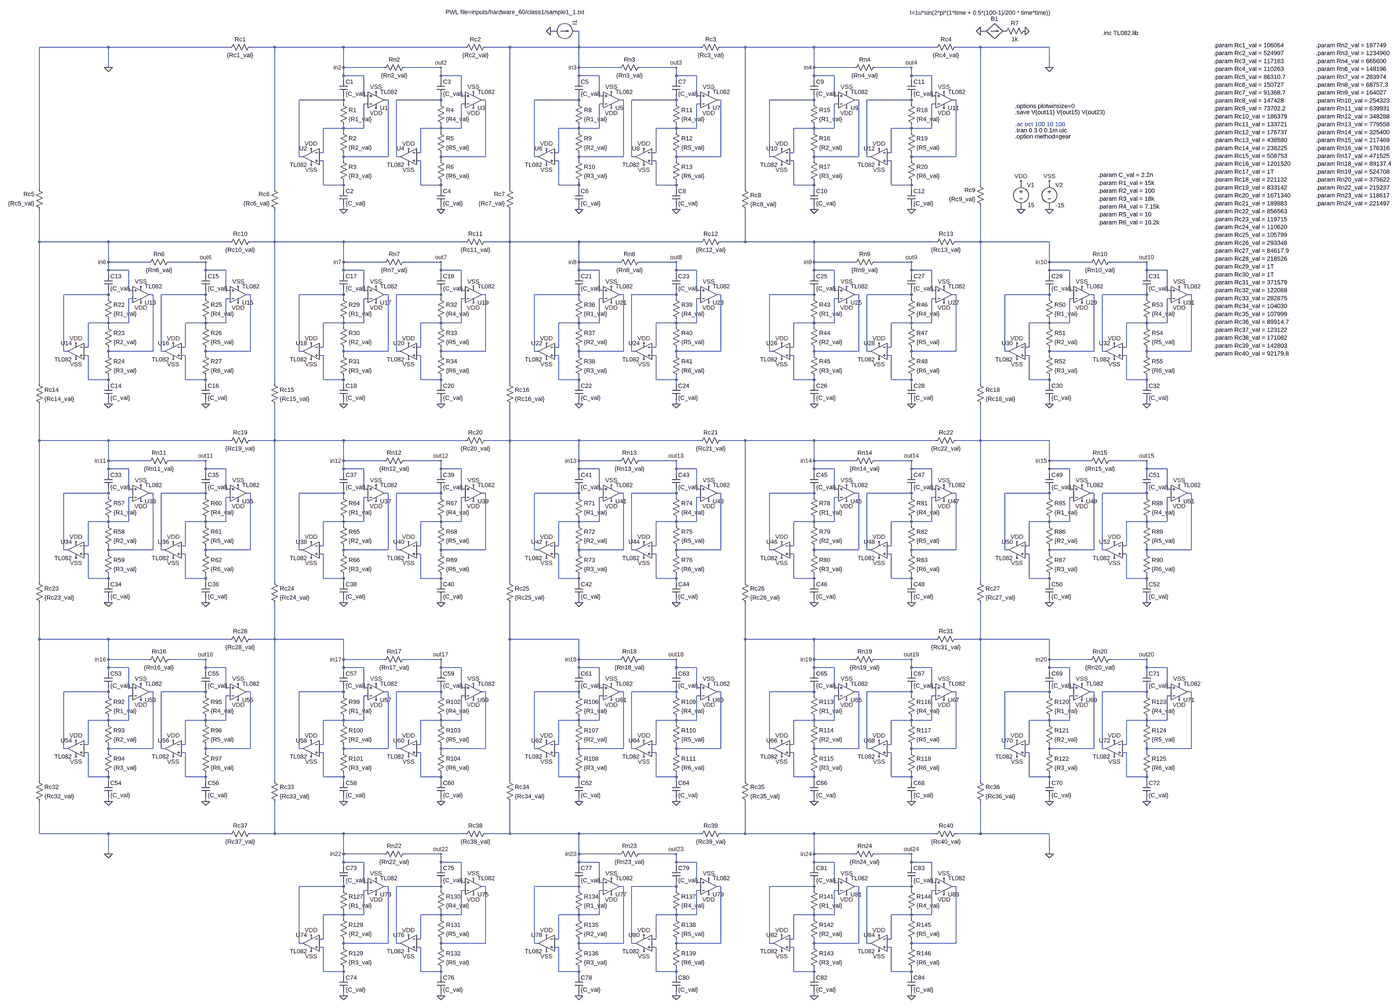
[diagram p0: schematic pulse_tactile.asc, whole sheet]
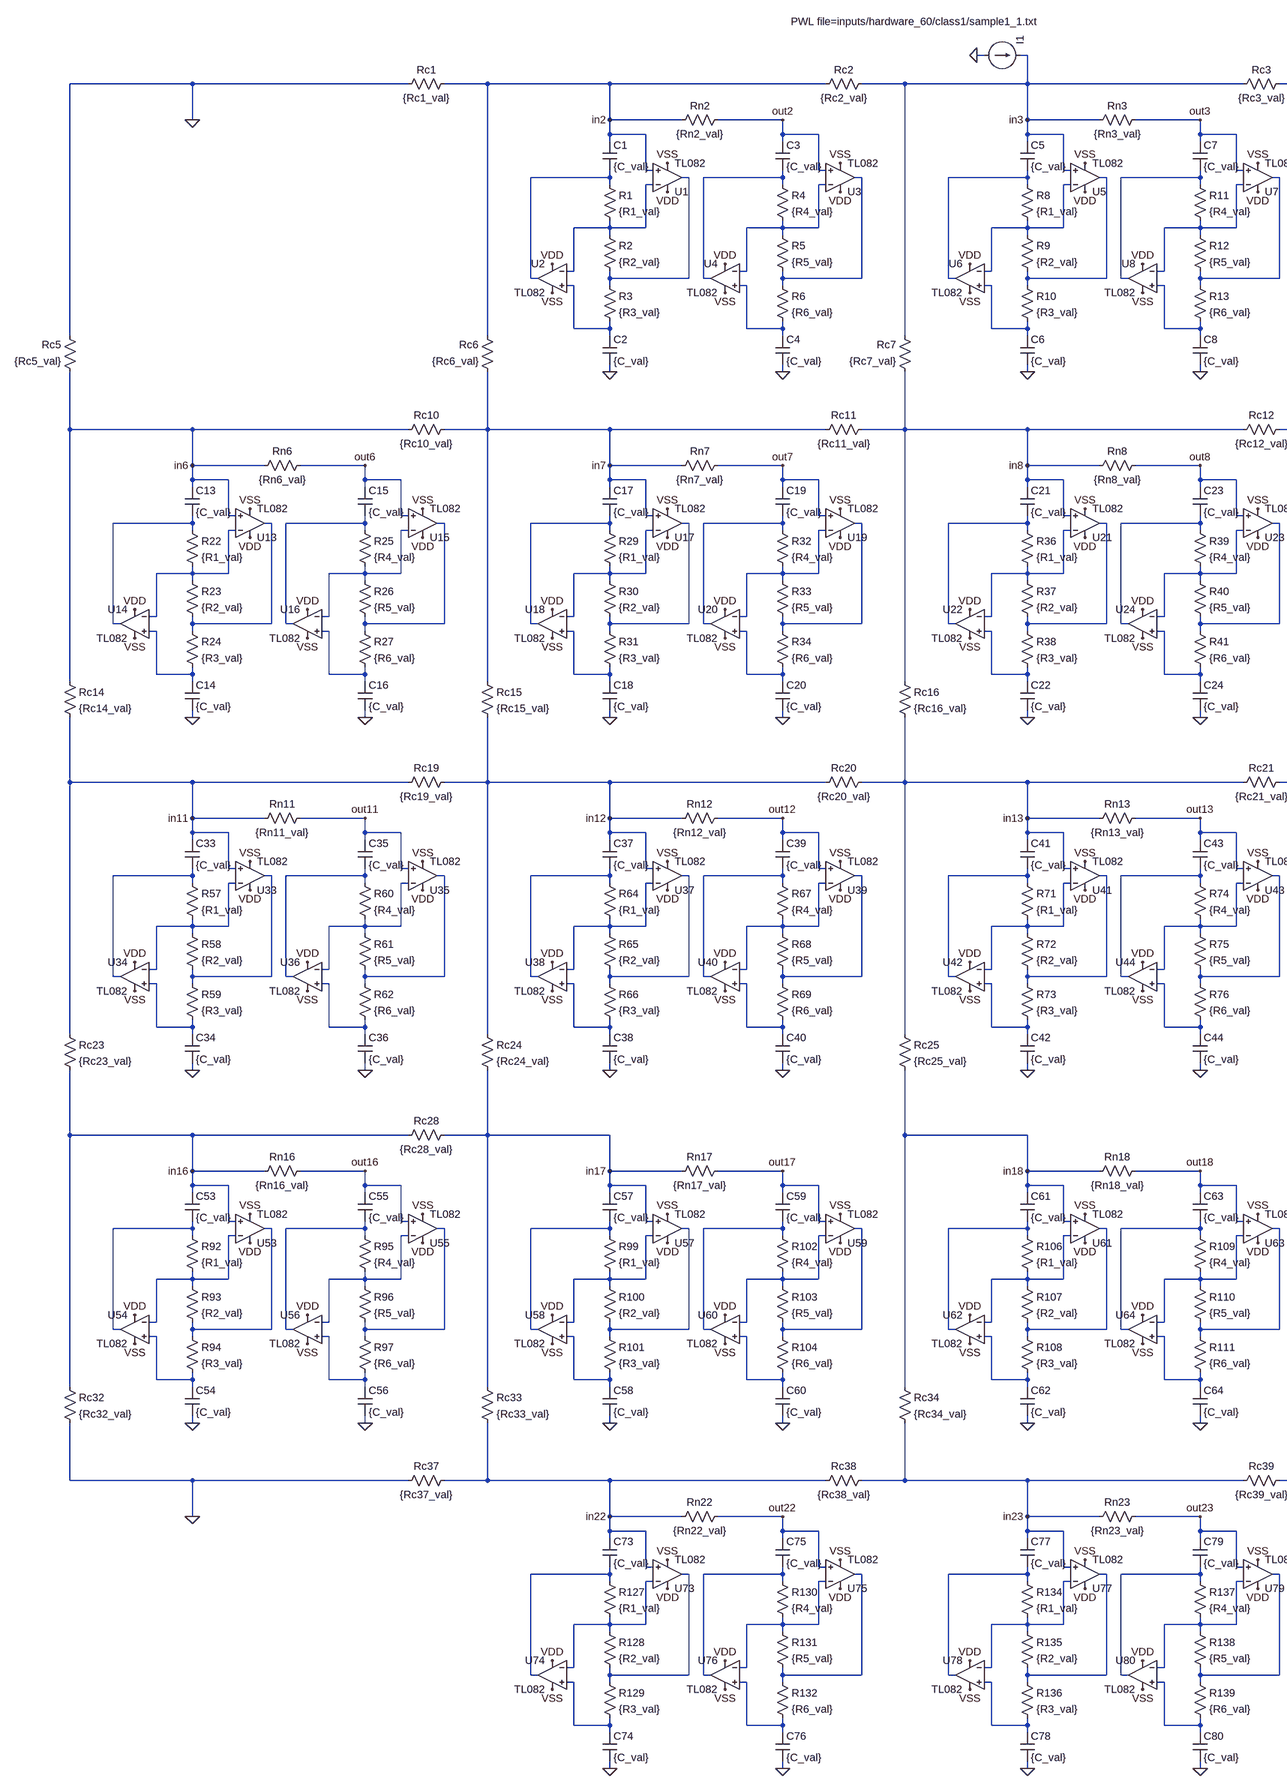
[diagram p1: schematic pulse_tactile.asc, part, row 1 of 1, column 1 of 2]
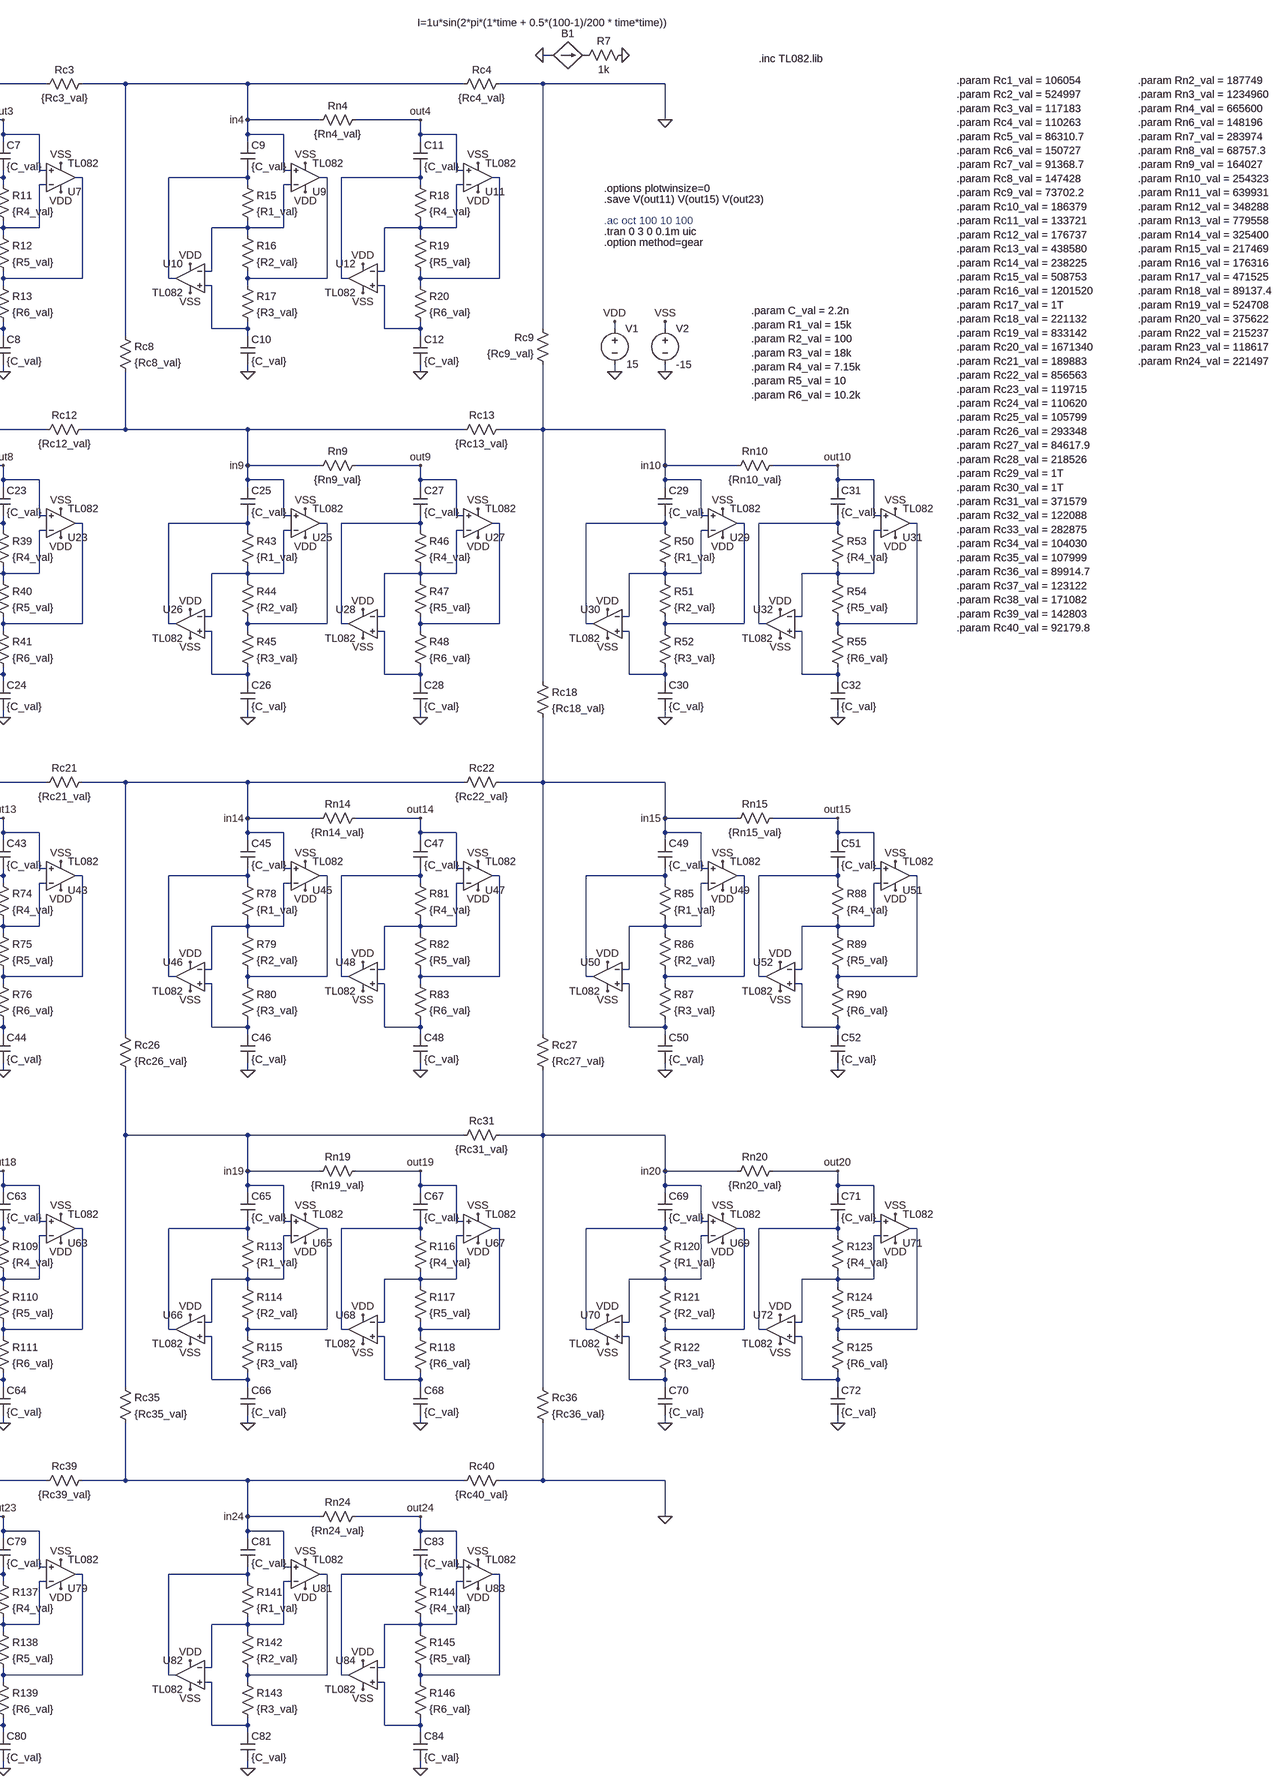
[diagram p2: schematic pulse_tactile.asc, part, row 1 of 1, column 2 of 2]
* pulse_tactile.asc
V1 VDD 0 15
V2 VSS 0 -15
C1 in2 N001 {C_val}
R1 N001 N013 {R1_val}
R2 N013 N002 {R2_val}
R3 N002 N019 {R3_val}
C2 N019 0 {C_val}
C3 out2 N003 {C_val}
R4 N003 N014 {R4_val}
R5 N014 N004 {R5_val}
R6 N004 N020 {R6_val}
C4 N020 0 {C_val}
Rn2 out2 in2 {Rn2_val}
C5 in3 N005 {C_val}
R8 N005 N015 {R1_val}
R9 N015 N006 {R2_val}
R10 N006 N021 {R3_val}
C6 N021 0 {C_val}
C7 out3 N007 {C_val}
R11 N007 N016 {R4_val}
R12 N016 N008 {R5_val}
R13 N008 N022 {R6_val}
C8 N022 0 {C_val}
Rn3 out3 in3 {Rn3_val}
C9 in4 N009 {C_val}
R15 N009 N017 {R1_val}
R16 N017 N010 {R2_val}
R17 N010 N023 {R3_val}
C10 N023 0 {C_val}
C11 out4 N011 {C_val}
R18 N011 N018 {R4_val}
R19 N018 N012 {R5_val}
R20 N012 N024 {R6_val}
C12 N024 0 {C_val}
Rn4 out4 in4 {Rn4_val}
C13 in6 N025 {C_val}
R22 N025 N045 {R1_val}
R23 N045 N026 {R2_val}
R24 N026 N055 {R3_val}
C14 N055 0 {C_val}
C15 out6 N027 {C_val}
R25 N027 N046 {R4_val}
R26 N046 N028 {R5_val}
R27 N028 N056 {R6_val}
C16 N056 0 {C_val}
Rn6 out6 in6 {Rn6_val}
C17 in7 N029 {C_val}
R29 N029 N047 {R1_val}
R30 N047 N030 {R2_val}
R31 N030 N057 {R3_val}
C18 N057 0 {C_val}
C19 out7 N031 {C_val}
R32 N031 N048 {R4_val}
R33 N048 N032 {R5_val}
R34 N032 N058 {R6_val}
C20 N058 0 {C_val}
Rn7 out7 in7 {Rn7_val}
C21 in8 N033 {C_val}
R36 N033 N049 {R1_val}
R37 N049 N034 {R2_val}
R38 N034 N059 {R3_val}
C22 N059 0 {C_val}
C23 out8 N035 {C_val}
R39 N035 N050 {R4_val}
R40 N050 N036 {R5_val}
R41 N036 N060 {R6_val}
C24 N060 0 {C_val}
Rn8 out8 in8 {Rn8_val}
C25 in9 N037 {C_val}
R43 N037 N051 {R1_val}
R44 N051 N038 {R2_val}
R45 N038 N061 {R3_val}
C26 N061 0 {C_val}
C27 out9 N039 {C_val}
R46 N039 N052 {R4_val}
R47 N052 N040 {R5_val}
R48 N040 N062 {R6_val}
C28 N062 0 {C_val}
Rn9 out9 in9 {Rn9_val}
C29 in10 N041 {C_val}
R50 N041 N053 {R1_val}
R51 N053 N042 {R2_val}
R52 N042 N063 {R3_val}
C30 N063 0 {C_val}
C31 out10 N043 {C_val}
R53 N043 N054 {R4_val}
R54 N054 N044 {R5_val}
R55 N044 N064 {R6_val}
C32 N064 0 {C_val}
Rn10 out10 in10 {Rn10_val}
C33 in11 N065 {C_val}
R57 N065 N085 {R1_val}
R58 N085 N066 {R2_val}
R59 N066 N095 {R3_val}
C34 N095 0 {C_val}
C35 out11 N067 {C_val}
R60 N067 N086 {R4_val}
R61 N086 N068 {R5_val}
R62 N068 N096 {R6_val}
C36 N096 0 {C_val}
Rn11 out11 in11 {Rn11_val}
C37 in12 N069 {C_val}
R64 N069 N087 {R1_val}
R65 N087 N070 {R2_val}
R66 N070 N097 {R3_val}
C38 N097 0 {C_val}
C39 out12 N071 {C_val}
R67 N071 N088 {R4_val}
R68 N088 N072 {R5_val}
R69 N072 N098 {R6_val}
C40 N098 0 {C_val}
Rn12 out12 in12 {Rn12_val}
C41 in13 N073 {C_val}
R71 N073 N089 {R1_val}
R72 N089 N074 {R2_val}
R73 N074 N099 {R3_val}
C42 N099 0 {C_val}
C43 out13 N075 {C_val}
R74 N075 N090 {R4_val}
R75 N090 N076 {R5_val}
R76 N076 N100 {R6_val}
C44 N100 0 {C_val}
Rn13 out13 in13 {Rn13_val}
C45 in14 N077 {C_val}
R78 N077 N091 {R1_val}
R79 N091 N078 {R2_val}
R80 N078 N101 {R3_val}
C46 N101 0 {C_val}
C47 out14 N079 {C_val}
R81 N079 N092 {R4_val}
R82 N092 N080 {R5_val}
R83 N080 N102 {R6_val}
C48 N102 0 {C_val}
Rn14 out14 in14 {Rn14_val}
C49 in15 N081 {C_val}
R85 N081 N093 {R1_val}
R86 N093 N082 {R2_val}
R87 N082 N103 {R3_val}
C50 N103 0 {C_val}
C51 out15 N083 {C_val}
R88 N083 N094 {R4_val}
R89 N094 N084 {R5_val}
R90 N084 N104 {R6_val}
C52 N104 0 {C_val}
Rn15 out15 in15 {Rn15_val}
C53 in16 N105 {C_val}
R92 N105 N125 {R1_val}
R93 N125 N106 {R2_val}
R94 N106 N135 {R3_val}
C54 N135 0 {C_val}
C55 out16 N107 {C_val}
R95 N107 N126 {R4_val}
R96 N126 N108 {R5_val}
R97 N108 N136 {R6_val}
C56 N136 0 {C_val}
Rn16 out16 in16 {Rn16_val}
C57 in17 N109 {C_val}
R99 N109 N127 {R1_val}
R100 N127 N110 {R2_val}
R101 N110 N137 {R3_val}
C58 N137 0 {C_val}
C59 out17 N111 {C_val}
R102 N111 N128 {R4_val}
R103 N128 N112 {R5_val}
R104 N112 N138 {R6_val}
C60 N138 0 {C_val}
Rn17 out17 in17 {Rn17_val}
C61 in18 N113 {C_val}
R106 N113 N129 {R1_val}
R107 N129 N114 {R2_val}
R108 N114 N139 {R3_val}
C62 N139 0 {C_val}
C63 out18 N115 {C_val}
R109 N115 N130 {R4_val}
R110 N130 N116 {R5_val}
R111 N116 N140 {R6_val}
C64 N140 0 {C_val}
Rn18 out18 in18 {Rn18_val}
C65 in19 N117 {C_val}
R113 N117 N131 {R1_val}
R114 N131 N118 {R2_val}
R115 N118 N141 {R3_val}
C66 N141 0 {C_val}
C67 out19 N119 {C_val}
R116 N119 N132 {R4_val}
R117 N132 N120 {R5_val}
R118 N120 N142 {R6_val}
C68 N142 0 {C_val}
Rn19 out19 in19 {Rn19_val}
C69 in20 N121 {C_val}
R120 N121 N133 {R1_val}
R121 N133 N122 {R2_val}
R122 N122 N143 {R3_val}
C70 N143 0 {C_val}
C71 out20 N123 {C_val}
R123 N123 N134 {R4_val}
R124 N134 N124 {R5_val}
R125 N124 N144 {R6_val}
C72 N144 0 {C_val}
Rn20 out20 in20 {Rn20_val}
C73 in22 N145 {C_val}
R127 N145 N157 {R1_val}
R128 N157 N146 {R2_val}
R129 N146 N163 {R3_val}
C74 N163 0 {C_val}
C75 out22 N147 {C_val}
R130 N147 N158 {R4_val}
R131 N158 N148 {R5_val}
R132 N148 N164 {R6_val}
C76 N164 0 {C_val}
Rn22 out22 in22 {Rn22_val}
C77 in23 N149 {C_val}
R134 N149 N159 {R1_val}
R135 N159 N150 {R2_val}
R136 N150 N165 {R3_val}
C78 N165 0 {C_val}
C79 out23 N151 {C_val}
R137 N151 N160 {R4_val}
R138 N160 N152 {R5_val}
R139 N152 N166 {R6_val}
C80 N166 0 {C_val}
Rn23 out23 in23 {Rn23_val}
C81 in24 N153 {C_val}
R141 N153 N161 {R1_val}
R142 N161 N154 {R2_val}
R143 N154 N167 {R3_val}
C82 N167 0 {C_val}
C83 out24 N155 {C_val}
R144 N155 N162 {R4_val}
R145 N162 N156 {R5_val}
R146 N156 N168 {R6_val}
C84 N168 0 {C_val}
Rn24 out24 in24 {Rn24_val}
Rc2 in3 in2 {Rc2_val}
Rc3 in4 in3 {Rc3_val}
Rc6 in7 in2 {Rc6_val}
Rc7 in8 in3 {Rc7_val}
Rc11 in7 in8 {Rc11_val}
Rc12 in8 in9 {Rc12_val}
Rc13 in9 in10 {Rc13_val}
Rc14 in6 in11 {Rc14_val}
Rc15 in7 in12 {Rc15_val}
Rc16 in8 in13 {Rc16_val}
Rc18 in10 in15 {Rc18_val}
Rc21 in14 in13 {Rc21_val}
Rc22 in15 in14 {Rc22_val}
Rc23 in11 in16 {Rc23_val}
Rc24 in12 in17 {Rc24_val}
Rc25 in13 in18 {Rc25_val}
Rc26 in14 in19 {Rc26_val}
Rc27 in15 in20 {Rc27_val}
Rc28 in17 in16 {Rc28_val}
Rc32 in16 0 {Rc32_val}
Rc33 in17 in22 {Rc33_val}
Rc34 in18 in23 {Rc34_val}
Rc35 in19 in24 {Rc35_val}
Rc36 in20 0 {Rc36_val}
Rc1 in2 0 {Rc1_val}
Rc5 in6 0 {Rc5_val}
Rc9 in10 0 {Rc9_val}
Rc4 in4 0 {Rc4_val}
Rc37 in22 0 {Rc37_val}
Rc38 in23 in22 {Rc38_val}
Rc39 in24 in23 {Rc39_val}
Rc40 0 in24 {Rc40_val}
R7 0 P001 1k
B1 0 P001 I=1u*sin(2*pi*(1*time + 0.5*(100-1)/200 * time*time))
I1 0 in3 PWL file=inputs/hardware_60/class1/sample1_1.txt
X§U1 in2 N013 VDD VSS N002 TL082  ; pins In+ In- V+ V- OUT
X§U2 N019 N013 VDD VSS N001 TL082  ; pins In+ In- V+ V- OUT
X§U3 out2 N014 VDD VSS N004 TL082  ; pins In+ In- V+ V- OUT
X§U4 N020 N014 VDD VSS N003 TL082  ; pins In+ In- V+ V- OUT
X§U5 in3 N015 VDD VSS N006 TL082  ; pins In+ In- V+ V- OUT
X§U6 N021 N015 VDD VSS N005 TL082  ; pins In+ In- V+ V- OUT
X§U7 out3 N016 VDD VSS N008 TL082  ; pins In+ In- V+ V- OUT
X§U8 N022 N016 VDD VSS N007 TL082  ; pins In+ In- V+ V- OUT
X§U9 in4 N017 VDD VSS N010 TL082  ; pins In+ In- V+ V- OUT
X§U10 N023 N017 VDD VSS N009 TL082  ; pins In+ In- V+ V- OUT
X§U11 out4 N018 VDD VSS N012 TL082  ; pins In+ In- V+ V- OUT
X§U12 N024 N018 VDD VSS N011 TL082  ; pins In+ In- V+ V- OUT
X§U13 in6 N045 VDD VSS N026 TL082  ; pins In+ In- V+ V- OUT
X§U14 N055 N045 VDD VSS N025 TL082  ; pins In+ In- V+ V- OUT
X§U15 out6 N046 VDD VSS N028 TL082  ; pins In+ In- V+ V- OUT
X§U16 N056 N046 VDD VSS N027 TL082  ; pins In+ In- V+ V- OUT
X§U17 in7 N047 VDD VSS N030 TL082  ; pins In+ In- V+ V- OUT
X§U18 N057 N047 VDD VSS N029 TL082  ; pins In+ In- V+ V- OUT
X§U19 out7 N048 VDD VSS N032 TL082  ; pins In+ In- V+ V- OUT
X§U20 N058 N048 VDD VSS N031 TL082  ; pins In+ In- V+ V- OUT
X§U21 in8 N049 VDD VSS N034 TL082  ; pins In+ In- V+ V- OUT
X§U22 N059 N049 VDD VSS N033 TL082  ; pins In+ In- V+ V- OUT
X§U23 out8 N050 VDD VSS N036 TL082  ; pins In+ In- V+ V- OUT
X§U24 N060 N050 VDD VSS N035 TL082  ; pins In+ In- V+ V- OUT
X§U25 in9 N051 VDD VSS N038 TL082  ; pins In+ In- V+ V- OUT
X§U26 N061 N051 VDD VSS N037 TL082  ; pins In+ In- V+ V- OUT
X§U27 out9 N052 VDD VSS N040 TL082  ; pins In+ In- V+ V- OUT
X§U28 N062 N052 VDD VSS N039 TL082  ; pins In+ In- V+ V- OUT
X§U29 in10 N053 VDD VSS N042 TL082  ; pins In+ In- V+ V- OUT
X§U30 N063 N053 VDD VSS N041 TL082  ; pins In+ In- V+ V- OUT
X§U31 out10 N054 VDD VSS N044 TL082  ; pins In+ In- V+ V- OUT
X§U32 N064 N054 VDD VSS N043 TL082  ; pins In+ In- V+ V- OUT
X§U33 in11 N085 VDD VSS N066 TL082  ; pins In+ In- V+ V- OUT
X§U34 N095 N085 VDD VSS N065 TL082  ; pins In+ In- V+ V- OUT
X§U35 out11 N086 VDD VSS N068 TL082  ; pins In+ In- V+ V- OUT
X§U36 N096 N086 VDD VSS N067 TL082  ; pins In+ In- V+ V- OUT
X§U37 in12 N087 VDD VSS N070 TL082  ; pins In+ In- V+ V- OUT
X§U38 N097 N087 VDD VSS N069 TL082  ; pins In+ In- V+ V- OUT
X§U39 out12 N088 VDD VSS N072 TL082  ; pins In+ In- V+ V- OUT
X§U40 N098 N088 VDD VSS N071 TL082  ; pins In+ In- V+ V- OUT
X§U41 in13 N089 VDD VSS N074 TL082  ; pins In+ In- V+ V- OUT
X§U42 N099 N089 VDD VSS N073 TL082  ; pins In+ In- V+ V- OUT
X§U43 out13 N090 VDD VSS N076 TL082  ; pins In+ In- V+ V- OUT
X§U44 N100 N090 VDD VSS N075 TL082  ; pins In+ In- V+ V- OUT
X§U45 in14 N091 VDD VSS N078 TL082  ; pins In+ In- V+ V- OUT
X§U46 N101 N091 VDD VSS N077 TL082  ; pins In+ In- V+ V- OUT
X§U47 out14 N092 VDD VSS N080 TL082  ; pins In+ In- V+ V- OUT
X§U48 N102 N092 VDD VSS N079 TL082  ; pins In+ In- V+ V- OUT
X§U49 in15 N093 VDD VSS N082 TL082  ; pins In+ In- V+ V- OUT
X§U50 N103 N093 VDD VSS N081 TL082  ; pins In+ In- V+ V- OUT
X§U51 out15 N094 VDD VSS N084 TL082  ; pins In+ In- V+ V- OUT
X§U52 N104 N094 VDD VSS N083 TL082  ; pins In+ In- V+ V- OUT
X§U53 in16 N125 VDD VSS N106 TL082  ; pins In+ In- V+ V- OUT
X§U54 N135 N125 VDD VSS N105 TL082  ; pins In+ In- V+ V- OUT
X§U55 out16 N126 VDD VSS N108 TL082  ; pins In+ In- V+ V- OUT
X§U56 N136 N126 VDD VSS N107 TL082  ; pins In+ In- V+ V- OUT
X§U57 in17 N127 VDD VSS N110 TL082  ; pins In+ In- V+ V- OUT
X§U58 N137 N127 VDD VSS N109 TL082  ; pins In+ In- V+ V- OUT
X§U59 out17 N128 VDD VSS N112 TL082  ; pins In+ In- V+ V- OUT
X§U60 N138 N128 VDD VSS N111 TL082  ; pins In+ In- V+ V- OUT
X§U61 in18 N129 VDD VSS N114 TL082  ; pins In+ In- V+ V- OUT
X§U62 N139 N129 VDD VSS N113 TL082  ; pins In+ In- V+ V- OUT
X§U63 out18 N130 VDD VSS N116 TL082  ; pins In+ In- V+ V- OUT
X§U64 N140 N130 VDD VSS N115 TL082  ; pins In+ In- V+ V- OUT
X§U65 in19 N131 VDD VSS N118 TL082  ; pins In+ In- V+ V- OUT
X§U66 N141 N131 VDD VSS N117 TL082  ; pins In+ In- V+ V- OUT
X§U67 out19 N132 VDD VSS N120 TL082  ; pins In+ In- V+ V- OUT
X§U68 N142 N132 VDD VSS N119 TL082  ; pins In+ In- V+ V- OUT
X§U69 in20 N133 VDD VSS N122 TL082  ; pins In+ In- V+ V- OUT
X§U70 N143 N133 VDD VSS N121 TL082  ; pins In+ In- V+ V- OUT
X§U71 out20 N134 VDD VSS N124 TL082  ; pins In+ In- V+ V- OUT
X§U72 N144 N134 VDD VSS N123 TL082  ; pins In+ In- V+ V- OUT
X§U73 in22 N157 VDD VSS N146 TL082  ; pins In+ In- V+ V- OUT
X§U74 N163 N157 VDD VSS N145 TL082  ; pins In+ In- V+ V- OUT
X§U75 out22 N158 VDD VSS N148 TL082  ; pins In+ In- V+ V- OUT
X§U76 N164 N158 VDD VSS N147 TL082  ; pins In+ In- V+ V- OUT
X§U77 in23 N159 VDD VSS N150 TL082  ; pins In+ In- V+ V- OUT
X§U78 N165 N159 VDD VSS N149 TL082  ; pins In+ In- V+ V- OUT
X§U79 out23 N160 VDD VSS N152 TL082  ; pins In+ In- V+ V- OUT
X§U80 N166 N160 VDD VSS N151 TL082  ; pins In+ In- V+ V- OUT
X§U81 in24 N161 VDD VSS N154 TL082  ; pins In+ In- V+ V- OUT
X§U82 N167 N161 VDD VSS N153 TL082  ; pins In+ In- V+ V- OUT
X§U83 out24 N162 VDD VSS N156 TL082  ; pins In+ In- V+ V- OUT
X§U84 N168 N162 VDD VSS N155 TL082  ; pins In+ In- V+ V- OUT
Rc8 in4 in9 {Rc8_val}
Rc10 in7 in6 {Rc10_val}
Rc19 in12 in11 {Rc19_val}
Rc20 in13 in12 {Rc20_val}
Rc31 in20 in19 {Rc31_val}
* .ac oct 100 10 100
.tran 0 3 0 0.1m uic
.option method=gear
.inc TL082.lib
.param C_val = 2.2n
.param R1_val = 15k
.param R2_val = 100
.param R3_val = 18k
.param R4_val = 7.15k
.param R5_val = 10
.param R6_val = 10.2k
.param Rc1_val = 106054
.param Rc2_val = 524997
.param Rc3_val = 117183
.param Rc4_val = 110263
.param Rc5_val = 86310.7
.param Rc6_val = 150727
.param Rc7_val = 91368.7
.param Rc8_val = 147428
.param Rc9_val = 73702.2
.param Rc10_val = 186379
.param Rc11_val = 133721
.param Rc12_val = 176737
.param Rc13_val = 438580
.param Rc14_val = 238225
.param Rc15_val = 508753
.param Rc16_val = 1201520
.param Rc17_val = 1T
.param Rc18_val = 221132
.param Rc19_val = 833142
.param Rc20_val = 1671340
.param Rc21_val = 189883
.param Rc22_val = 856563
.param Rc23_val = 119715
.param Rc24_val = 110620
.param Rc25_val = 105799
.param Rc26_val = 293348
.param Rc27_val = 84617.9
.param Rc28_val = 218526
.param Rc29_val = 1T
.param Rc30_val = 1T
.param Rc31_val = 371579
.param Rc32_val = 122088
.param Rc33_val = 282875
.param Rc34_val = 104030
.param Rc35_val = 107999
.param Rc36_val = 89914.7
.param Rc37_val = 123122
.param Rc38_val = 171082
.param Rc39_val = 142803
.param Rc40_val = 92179.8
.param Rn2_val = 187749
.param Rn3_val = 1234960
.param Rn4_val = 665600
.param Rn6_val = 148196
.param Rn7_val = 283974
.param Rn8_val = 68757.3
.param Rn9_val = 164027
.param Rn10_val = 254323
.param Rn11_val = 639931
.param Rn12_val = 348288
.param Rn13_val = 779558
.param Rn14_val = 325400
.param Rn15_val = 217469
.param Rn16_val = 176316
.param Rn17_val = 471525
.param Rn18_val = 89137.4
.param Rn19_val = 524708
.param Rn20_val = 375622
.param Rn22_val = 215237
.param Rn23_val = 118617
.param Rn24_val = 221497
.save V(out11) V(out15) V(out23)
.options plotwinsize=0
.backanno
.end